# Altium schematic sheet TEMP-HUMIDITY.SchDoc
size A4; SheetNumber: 4; SheetTotal: 5
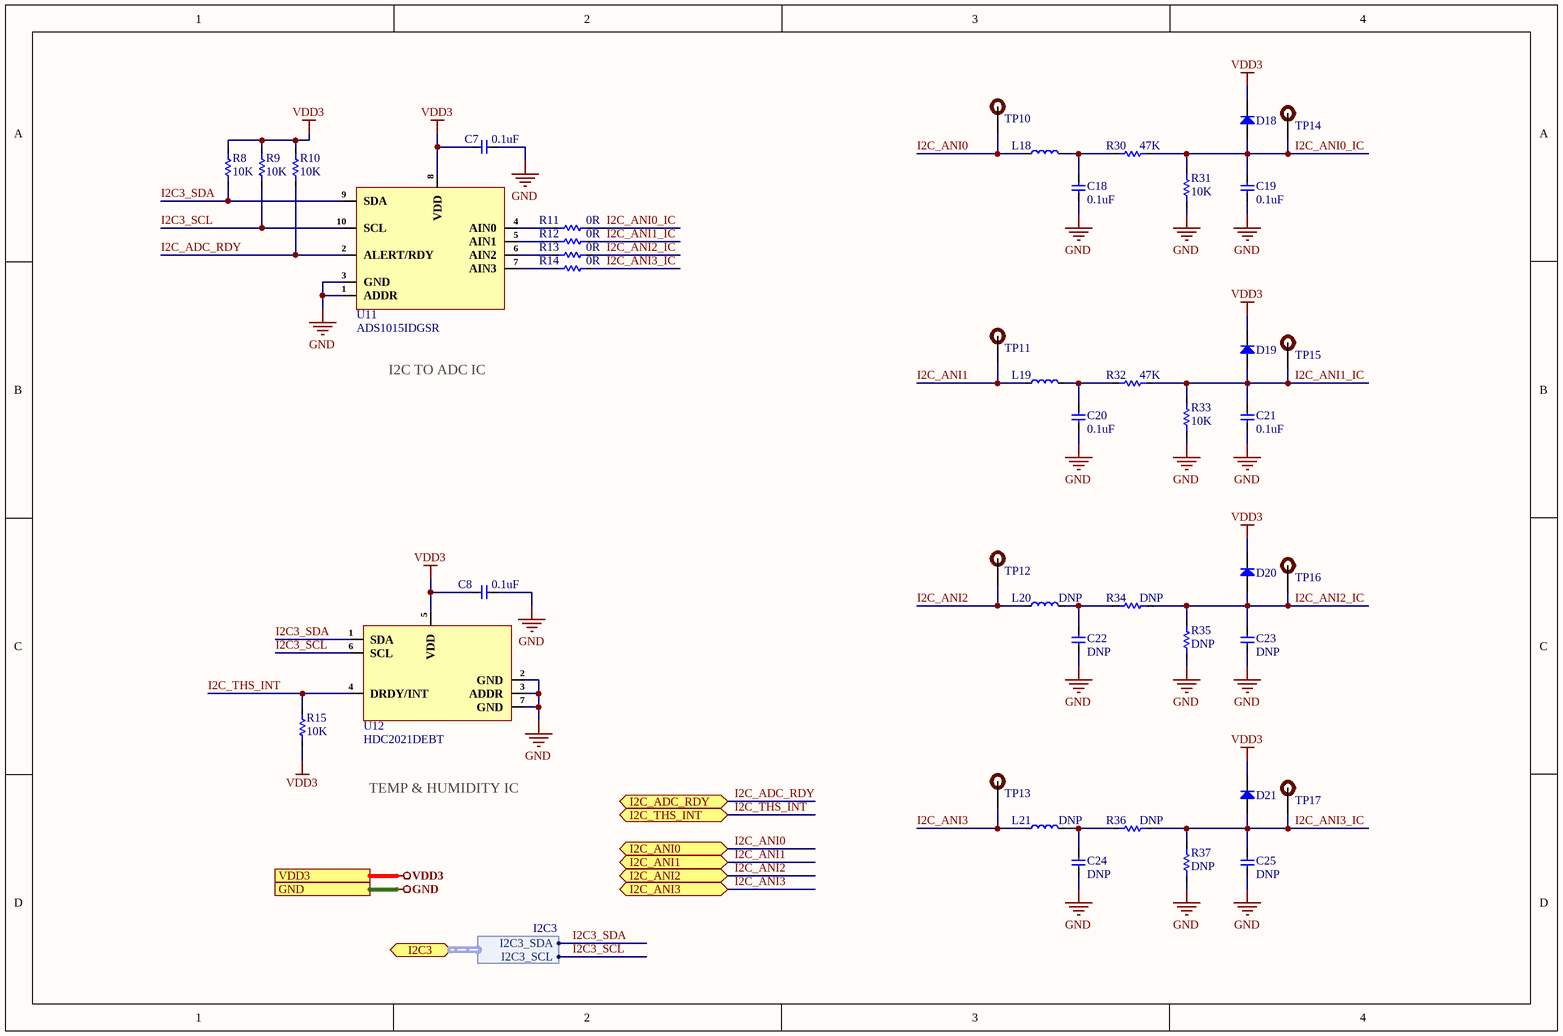
[diagram p0: TEMP-HUMIDITY.SchDoc]

## Parts
C7  0.1uF  [Cap-0402]
C8  0.1uF  [Cap-0402]
C18  0.1uF  [Cap-0402]
C19  0.1uF  [Cap-0402]
C20  0.1uF  [Cap-0402]
C21  0.1uF  [Cap-0402]
C22  DNP  [Cap-0402]
C23  DNP  [Cap-0402]
C24  DNP  [Cap-0402]
C25  DNP  [Cap-0402]
D18  RRE07VTM6SFHTR  [TUMD2SM]  (value not drawn)
D19  RRE07VTM6SFHTR  [TUMD2SM]  (value not drawn)
D20  RRE07VTM6SFHTR  [TUMD2SM]  (value not drawn)
D21  RRE07VTM6SFHTR  [TUMD2SM]  (value not drawn)
L18  MPZ2012S102AT000  [Ind-0805]  (value not drawn)
L19  MPZ2012S102AT000  [Ind-0805]  (value not drawn)
L20  DNP  [Ind-0805]
L21  DNP  [Ind-0805]
R8  10K  [Res-0603]
R9  10K  [Res-0603]
R10  10K  [Res-0603]
R11  0R  [Res-0402]
R12  0R  [Res-0402]
R13  0R  [Res-0402]
R14  0R  [Res-0402]
R15  10K  [Res-0603]
R30  47K  [Res-0603]
R31  10K  [Res-0603]
R32  47K  [Res-0603]
R33  10K  [Res-0603]
R34  DNP  [Res-0603]
R35  DNP  [Res-0603]
R36  DNP  [Res-0603]
R37  DNP  [Res-0603]
TP10  DNP  [Test-point]  (value not drawn)
TP11  DNP  [Test-point]  (value not drawn)
TP12  DNP  [Test-point]  (value not drawn)
TP13  DNP  [Test-point]  (value not drawn)
TP14  DNP  [Test-point]  (value not drawn)
TP15  DNP  [Test-point]  (value not drawn)
TP16  DNP  [Test-point]  (value not drawn)
TP17  DNP  [Test-point]  (value not drawn)
U11  ADS1015IDGSR  [10-VSSOP]
U12  HDC2021DEBT  [HDC2021DEBT]

## Ports
GND (see Top-Sheet[3C], Connector-USB-Current-Limit[2D], I2C-To-GPIO-Expander[1D], ISOLATED-RELAYS[1D]), I2C3 (bidir, harness I2C3, see Top-Sheet[3C], Connector-USB-Current-Limit[3D]), I2C_ADC_RDY (bidir, see Top-Sheet[3C], Connector-USB-Current-Limit[4C]), I2C_ANI0 (bidir, see Top-Sheet[3C], Connector-USB-Current-Limit[4C]), I2C_ANI1 (bidir, see Top-Sheet[3C], Connector-USB-Current-Limit[4D]), I2C_ANI2 (bidir, see Top-Sheet[3C], Connector-USB-Current-Limit[4D]), I2C_ANI3 (bidir, see Top-Sheet[3C], Connector-USB-Current-Limit[4D]), I2C_THS_INT (bidir, see Top-Sheet[3C], Connector-USB-Current-Limit[4C]), VDD3 (see Top-Sheet[3C], Connector-USB-Current-Limit[2D], I2C-To-GPIO-Expander[1D])

## Harnesses
I2C3: I2C3_SDA, I2C3_SCL

## Nets
GND: C7.2 C8.2 C18.1 C19.1 C20.1 C21.1 C22.1 C23.1 C24.1 C25.1 R31.1 R33.1 R35.1 R37.1 U11.1(ADDR) U11.3(GND) U12.2(GND) U12.3(ADDR) U12.7(GND) ; port GND
VDD3: C7.1 C8.1 D18.1(K) D19.1(K) D20.1(K) D21.1(K) R8.2 R9.2 R10.2 R15.1 U11.8(VDD) U12.5(VDD) ; port VDD3
I2C3_SCL: R9.1 U11.10(SCL) U12.6(SCL) ; port I2C3.I2C3_SCL
I2C3_SDA: R8.1 U11.9(SDA) U12.1(SDA) ; port I2C3.I2C3_SDA
I2C_ADC_RDY: R10.1 U11.2(ALERT/RDY) ; port I2C_ADC_RDY
I2C_ANI0: L18.1 TP10.1 ; port I2C_ANI0
I2C_ANI0_IC: C19.2 D18.2(A) R11.2 R30.2 R31.2 TP14.1
I2C_ANI1: L19.1 TP11.1 ; port I2C_ANI1
I2C_ANI1_IC: C21.2 D19.2(A) R12.2 R32.2 R33.2 TP15.1
I2C_ANI2: L20.1 TP12.1 ; port I2C_ANI2
I2C_ANI2_IC: C23.2 D20.2(A) R13.2 R34.2 R35.2 TP16.1
I2C_ANI3: L21.1 TP13.1 ; port I2C_ANI3
I2C_ANI3_IC: C25.2 D21.2(A) R14.2 R36.2 R37.2 TP17.1
I2C_THS_INT: R15.2 U12.4(DRDY/INT) ; port I2C_THS_INT
NetC18_2: C18.2 L18.2 R30.1
NetC20_2: C20.2 L19.2 R32.1
NetC22_2: C22.2 L20.2 R34.1
NetC24_2: C24.2 L21.2 R36.1
NetR11_1: R11.1 U11.4(AIN0)
NetR12_1: R12.1 U11.5(AIN1)
NetR13_1: R13.1 U11.6(AIN2)
NetR14_1: R14.1 U11.7(AIN3)

## Notes on the sheet
- I2C TO ADC IC
- TEMP & HUMIDITY IC

## Library data of the parts
C7 C8 C18-C25 = GRM155R71C104KA88J: CAP CER 0.1UF 16V X7R 0402; Manufacturer: Murata; Material: 4241ConductorMaterial; Value: 100nF; Tolerance: 10%; Supplier: Arrow Electronics; Supplier Part Number: GRM155R71C104KA88J; Manufacturer Part Number: GRM155R71C104KA88J; RoHS: Yes; Category: Ceramic Capacitors; Stock: 300000; Pricing: 50000=0.004, 100000=0.0034, 150000=0.0033 (USD); Mounting Technology: Surface Mount; Case/Package: 0402; Pins: 2NUMBER; Case Code (Metric): 1005; Case Code (Imperial): 0402; Min Operating Temperature: -55°C; Max Operating Temperature: 125°C; Package Quantity: 1; Voltage Rating: 16V; Packaging: Tape and Reel; Dielectric: X7R; Voltage Rating (DC): 16V; Termination: SMD/SMT; Voltage: 16V; Series: GRM; Construction: Flat; Length: 1mm; Width: 0.02inch; Height: 0.5mm; Thickness: 0.022inch; Depth: 0.5mm; Radiation Hardening: No; Reach SVHC Compliant: No; Lead Free: Lead Free; RoHS Compliant: Yes; ComponentLink1URL: https://datasheet.ciiva.com/6271/product-6271168.pdf?src-supplier=Digi-Key; ComponentLink1Description: https://datasheet.ciiva.com/6271/product-6271168.pdf?src-supplier=Digi-Key; ComponentLink2URL: https://datasheet.ciiva.com/6271/grm155r71c104ka88-01-6271231.pdf?src-supplier=Digi-Key; ComponentLink2Description: https://datasheet.ciiva.com/6271/grm155r71c104ka88-01-6271231.pdf?src-supplier=Digi-Key
D18-D21 = RRE07VTM6SFHTR: DIODE GP 600V 700MA TUMD2SM; Manufacturer: Rohm; Max Forward Surge Current (Ifsm): 2A; Supplier: Digi-Key; Supplier Part Number: RRE07VTM6SFHCT-ND; Manufacturer Part Number: RRE07VTM6SFHTR; RoHS: Yes; Category: Rectifier Diodes; Stock: 3000; Pricing: 1=0.43, 10=0.308, 100=0.1552, 500=0.13758, 1000=0.10706 (USD); Pins: 2; Max Operating Temperature: 150°C; Max Repetitive Reverse Voltage (Vrrm): 600V; Forward Current: 700mA; Packaging: Cut Tape; Reach SVHC Compliant: No; RoHS Compliant: Yes; ComponentLink1URL: http://www.farnell.com/datasheets/2067225.pdf?src-supplier=Farnell; ComponentLink1Description: http://www.farnell.com/datasheets/2067225.pdf?src-supplier=Farnell; ComponentLink2URL: http://www.farnell.com/datasheets/2067225.pdf?src-supplier=Element14; ComponentLink2Description: http://www.farnell.com/datasheets/2067225.pdf?src-supplier=Element14
L18-L21 = MPZ2012S102AT000: FERRITE BEAD 1K OHM 0805 1LN; Manufacturer: TDK; Supplier: Avnet; Supplier Part Number: MPZ2012S102AT000; Manufacturer Part Number: MPZ2012S102AT000; RoHS: Yes; Category: Ferrite Beads and Chips; Stock: 20000; Pricing: 4000=0.03386, 8000=0.03203, 16000=0.0302, 24000=0.02759, 32000=0.02581 (USD); ComponentLink1URL: https://datasheet.ciiva.com/46381/1856146-46381611.pdf?src-supplier=Element14; ComponentLink1Description: https://datasheet.ciiva.com/46381/1856146-46381611.pdf?src-supplier=Element14; ComponentLink2URL: https://datasheet.ciiva.com/48682/beads-commercial-power-mpz-en-48682506.pdf?src-supplier=Avnet; ComponentLink2Description: https://datasheet.ciiva.com/48682/beads-commercial-power-mpz-en-48682506.pdf?src-supplier=Avnet; ComponentLink3URL: https://datasheet.ciiva.com/46634/beads-commercial-power-mpz-en-46634366.pdf?src-supplier=Digi-Key; ComponentLink3Description: https://datasheet.ciiva.com/46634/beads-commercial-power-mpz-en-46634366.pdf?src-supplier=Digi-Key; ComponentLink4URL: https://datasheet.ciiva.com/46634/beads-commercial-power-mpz-en-46634422.pdf?src-supplier=Digi-Key; ComponentLink4Description: https://datasheet.ciiva.com/46634/beads-commercial-power-mpz-en-46634422.pdf?src-supplier=Digi-Key; ComponentLink5URL: https://datasheet.ciiva.com/46634/beads-commercial-power-mpz-en-46634424.pdf?src-supplier=Digi-Key; ComponentLink5Description: https://datasheet.ciiva.com/46634/beads-commercial-power-mpz-en-46634424.pdf?src-supplier=Digi-Key
R8-R10 R15 R31 R33 R35 R37 = RCA060310K0FKEAHP: RES SMD 10K OHM 1% 1/10W 0603; Manufacturer: Vishay Dale; Value: 10kR; Max Power Dissipation: 250mW; Temperature Coefficient: 100ppm/°C; Supplier: Future Electronics; Supplier Part Number: 4171415; Manufacturer Part Number: RCA060310K0FKEAHP; RoHS: Yes; Category: Chip SMD Resistors; Stock: 10000; Pricing: 5000=0.0413, 10000=0.0403, 15000=0.0397, 25000=0.0389, 50000=0.0374 (USD); Case/Package: 0603; Case Code (Imperial): 0603; Case Code (Metric): 1608; Min Operating Temperature: -55°C; Max Operating Temperature: 155°C; Features: Automotive AEC-Q200,Anti-Sulfur; Packaging: Cut Tape; Tolerance: 1%; Number of Terminations: 2; Series: RCA-HP; Ratings: AEC-Q200; RoHS Compliant: Yes; ComponentLink1URL: http://www.vishay.com/docs/20067/rcahp.pdf?src-supplier=Digi-Key; ComponentLink1Description: http://www.vishay.com/docs/20067/rcahp.pdf?src-supplier=Digi-Key
R11-R14 = CRCW04020000Z0ED: RES SMD 0 OHM JUMPER 1/16W 0402; Manufacturer: Vishay; Value: 0mR; Voltage Rating: 50V; Max Power Dissipation: 63mW; Temperature Coefficient: 100ppm/°C; Tolerance: 5%; Supplier: Mouser; Supplier Part Number: 71-CRCW0402-0-E3; Manufacturer Part Number: CRCW04020000Z0ED; RoHS: Yes; Category: Chip SMD Resistors; Stock: 2904592; Pricing: 1=0.1, 10=0.017, 50=0.017, 100=0.008, 1000=0.006, 10000=0.004 (USD); Case/Package: 0402; Case Code (Imperial): 0402; Case Code (Metric): 1005; Contact Plating: Tin; Weight: 2.3E-05oz; Min Operating Temperature: -55°C; Max Operating Temperature: 155°C; Packaging: Tape and Reel; Number of Terminations: 2; Series: CRCW; Package Quantity: 10000; Power Rating: 63mW; Resistor Type: Thick Film; Termination: SMD/SMT; Voltage Rating (DC): 50V; Features: Automotive AEC-Q200; Construction: Rectangular; Length: 1mm; Width: 0.5mm; Height: 0.35mm; Depth: 0.5mm; Ratings: AEC-Q200; Radiation Hardening: No; Lead Free: Lead Free; RoHS Compliant: Yes; Reach SVHC Compliant: Unknown; Military Standard: Not; ComponentLink1URL: https://datasheet.ciiva.com/7841/1720486-7841802.pdf?src-supplier=Element14; ComponentLink1Description: https://datasheet.ciiva.com/7841/1720486-7841802.pdf?src-supplier=Element14; ComponentLink2URL: https://datasheet.ciiva.com/26311/fld-crcw-e3-data-en-26311550.pdf?src-supplier=Distrelec; ComponentLink2Description: https://datasheet.ciiva.com/26311/fld-crcw-e3-data-en-26311550.pdf?src-supplier=Distrelec; ComponentLink3URL: https://datasheet.ciiva.com/7841/1697337-7841468.pdf?src-supplier=Element14; ComponentLink3Description: https://datasheet.ciiva.com/7841/1697337-7841468.pdf?src-supplier=Element14; ComponentLink4URL: https://datasheet.ciiva.com/2461/dcrcwe3-2461963.pdf?src-supplier=Digi-Key; ComponentLink4Description: https://datasheet.ciiva.com/2461/dcrcwe3-2461963.pdf?src-supplier=Digi-Key; ComponentLink5URL: https://datasheet.ciiva.com/2461/dcrcwe3-2461964.pdf?src-supplier=Digi-Key; ComponentLink5Description: https://datasheet.ciiva.com/2461/dcrcwe3-2461964.pdf?src-supplier=Digi-Key; ComponentLink6URL: https://datasheet.ciiva.com/2461/dcrcwe3-2461962.pdf?src-supplier=Digi-Key; ComponentLink6Description: https://datasheet.ciiva.com/2461/dcrcwe3-2461962.pdf?src-supplier=Digi-Key; ComponentLink7URL: https://datasheet.ciiva.com/16761/70200976-16761309.pdf?src-supplier=Allied+Electronics; ComponentLink7Description: https://datasheet.ciiva.com/16761/70200976-16761309.pdf?src-supplier=Allied+Electronics; ComponentLink8URL: https://datasheet.ciiva.com/3255/dcrcwe3-3255944.pdf?src-supplier=Avnet; ComponentLink8Description: https://datasheet.ciiva.com/3255/dcrcwe3-3255944.pdf?src-supplier=Avnet
R30 R32 R34 R36 = AC0603JR-0747KL: RES SMD 47K OHM 5% 1/10W 0603; Manufacturer: Yageo; Power Rating: 100mW; Value: 47kR; Voltage Rating: 50V; Temperature Coefficient: 100ppm/°C; Supplier: Future Electronics; Supplier Part Number: 1055988; Manufacturer Part Number: AC0603JR-0747KL; RoHS: Yes; Category: Chip SMD Resistors; Stock: 65000; Pricing: 5000=0.0016, 75000=0.0015, 200000=0.0015, 750000=0.0014, 2000000=0.0013 (USD); Case/Package: 0603; Case Code (Imperial): 0603; Case Code (Metric): 1608; Min Operating Temperature: -55°C; Max Operating Temperature: 155°C; Packaging: Tape and Reel; Tolerance: 5%; Number of Terminations: 2; Termination: SMD/SMT; Max Power Dissipation: 100mW; Features: Moisture Resistant,Automotive AEC-Q200; Series: AC; Length: 1.6mm; Width: 0.8mm; Height: 0.45mm; Ratings: AEC-Q200; RoHS Compliant: Yes; ComponentLink1URL: http://www.mouser.com/ds/2/447/yageodocoutput-1111992.pdf?src-supplier=Mouser; ComponentLink1Description: http://www.mouser.com/ds/2/447/yageodocoutput-1111992.pdf?src-supplier=Mouser; ComponentLink2URL: https://datasheet.octopart.com/AC0603JR-0747KL-Yageo-datasheet-166720450.pdf?src-supplier=Future+Electronics; ComponentLink2Description: https://datasheet.octopart.com/AC0603JR-0747KL-Yageo-datasheet-166720450.pdf?src-supplier=Future+Electronics
TP10-TP17 = TEST POINT: Test Point ON; Item Type: TEST POINT
U11 = ADS1015IDGSR: IC ADC 12BIT SIGMA-DELTA 10VSSOP; Manufacturer: Texas Instruments; Operating Supply Voltage: 3.3V; Min Supply Voltage: 2V; Max Supply Voltage: 5.5V; Interface: I2C; Number of Converters: 1; Resolution: 12b; Number of Bits: 12; Sampling Rate: 3.3KS/s; Polarity: Bipolar; Integral Nonlinearity (INL): 0.5LSB; Supply Type: Single; Number of Inputs: 4; Power Dissipation: 900uW; Supplier 1: Digi-Key; Manufacturer Part Number: ADS1015IDGSR; RoHS: Yes; Category: Analog to Digital Converters (ADCs); Pricing 1: 1=3.09000, 10=2.77500, 25=2.62360, 100=2.27370, 250=2.15712, 500=1.93556, 1000=1.65000 (USD); Case/Package: VSSOP; Number of Pins: 10; Contact Plating: Gold; Min Operating Temperature: -40°C; Max Operating Temperature: 125°C; Packaging: Tape and Reel; Package Quantity: 2500; Number of A/D Converters: 1; Number of Elements: 1; Conversion Rate: 3.3KS/s; Max Supply Voltage (DC): 5.5V; Min Supply Voltage (DC): 2V; Series: -; Radiation Hardening: No; Reach SVHC Compliant: Yes; Lead Free: Lead Free; RoHS Compliant: Yes; ComponentLink1URL: https://datasheet.ciiva.com/14260/sbas473c-14260076.pdf?src-supplier=Avnet; ComponentLink1Description: https://datasheet.ciiva.com/14260/sbas473c-14260076.pdf?src-supplier=Avnet; ComponentLink2URL: https://datasheet.ciiva.com/6662/ads1013-6662716.pdf?src-supplier=Digi-Key; ComponentLink2Description: https://datasheet.ciiva.com/6662/ads1013-6662716.pdf?src-supplier=Digi-Key; Supplier Part Number 1: 296-41185-1-ND; LCSC Part Number: C193969; Item Type: IC
U12 = HDC2021DEBT: SENSOR MULT HUMIDITY/TEMP; Manufacturer: Texas Instruments; Supplier: Mouser; Supplier Part Number: 595-HDC2021DEBT; Manufacturer Part Number: HDC2021DEBT; RoHS: No; Category: Integrated Circuits (ICs); Stock: 4417; Pricing: 1=5.04, 10=3.2, 50=3.2, 100=3.1, 1000=2.42, 10000=2.33 (USD)